# EAGLE board Chronos (EAGLE 9.7.0)
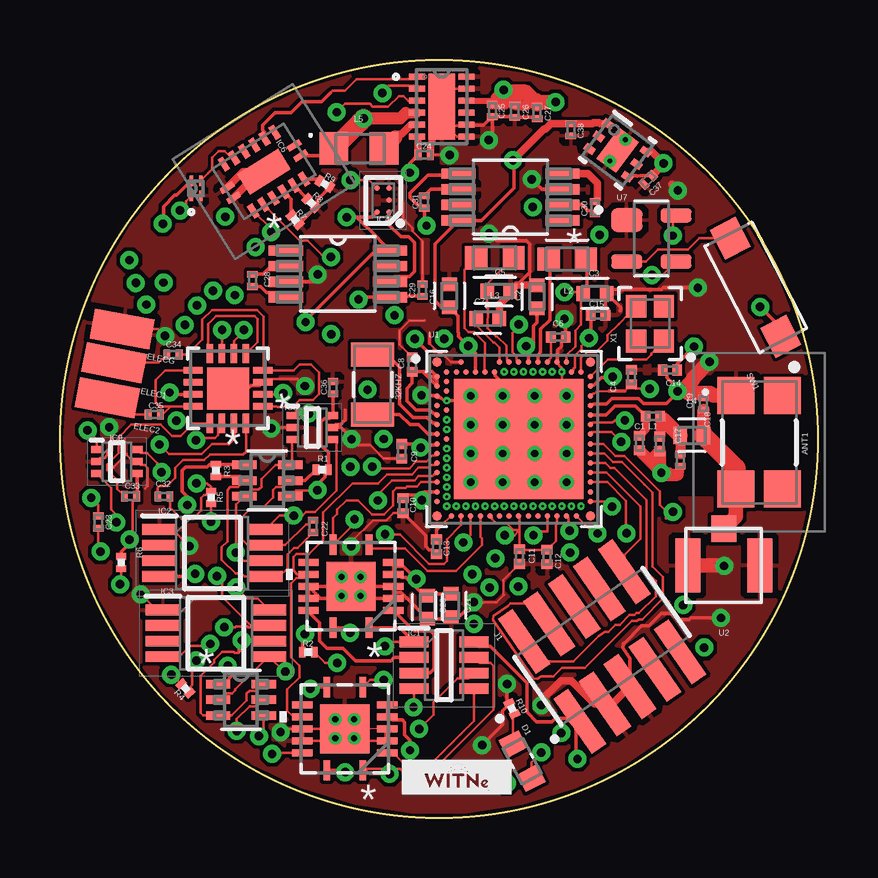
[diagram p3: board, top side]
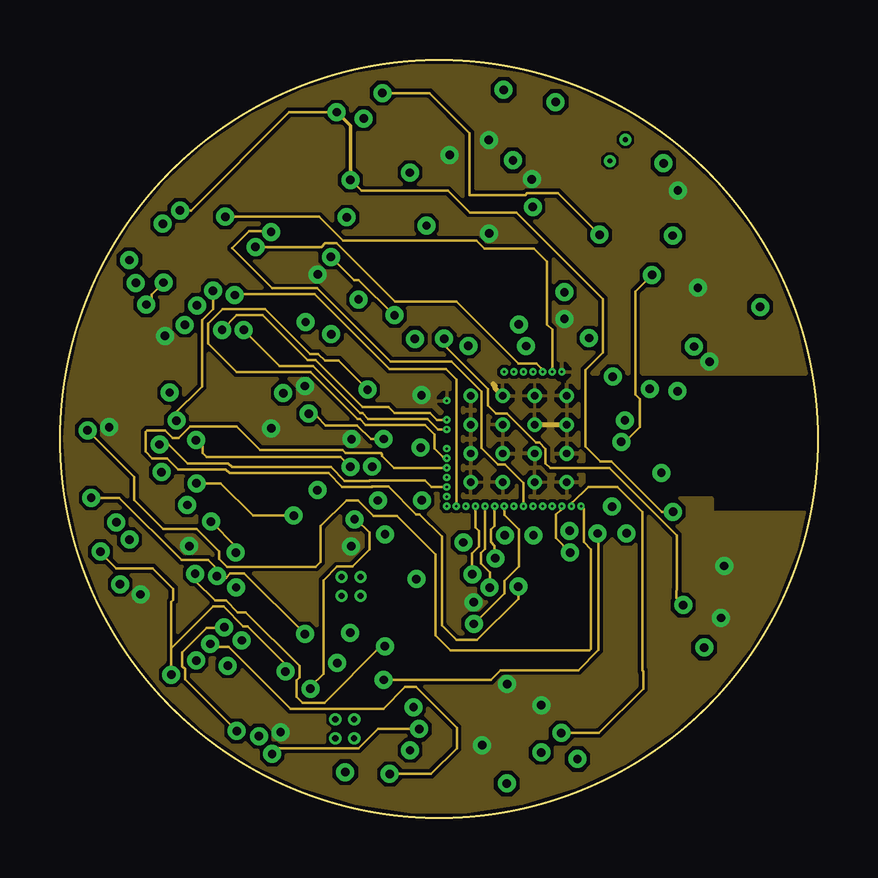
[diagram p4: board, inner layer Route2]
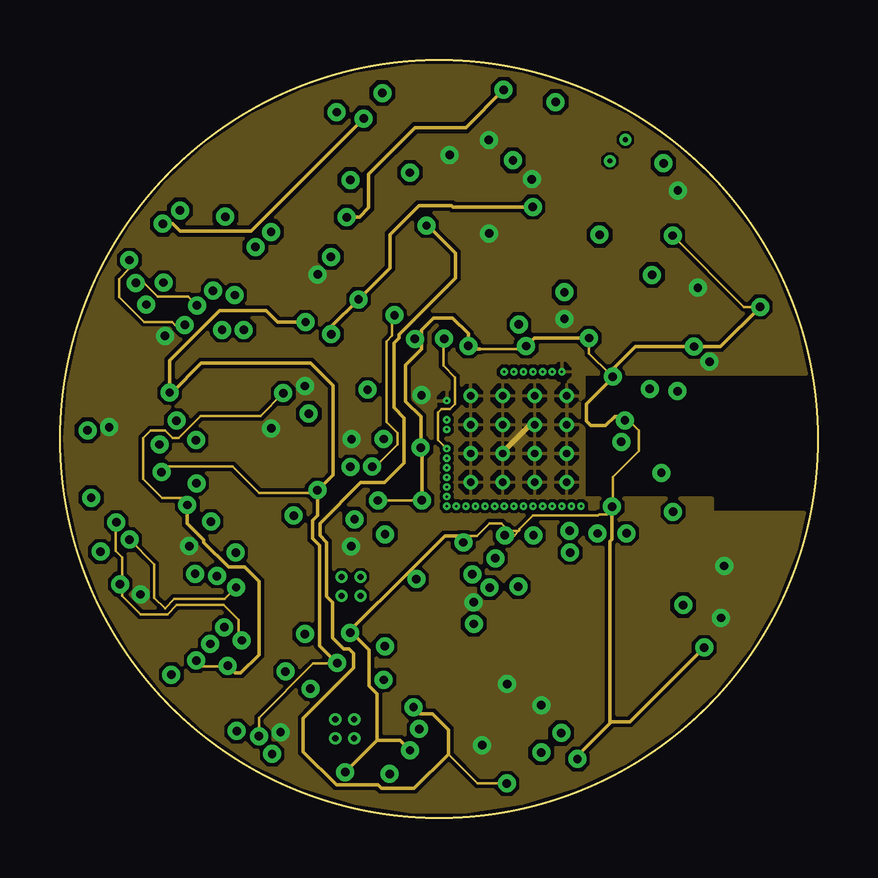
[diagram p5: board, inner layer Route15]
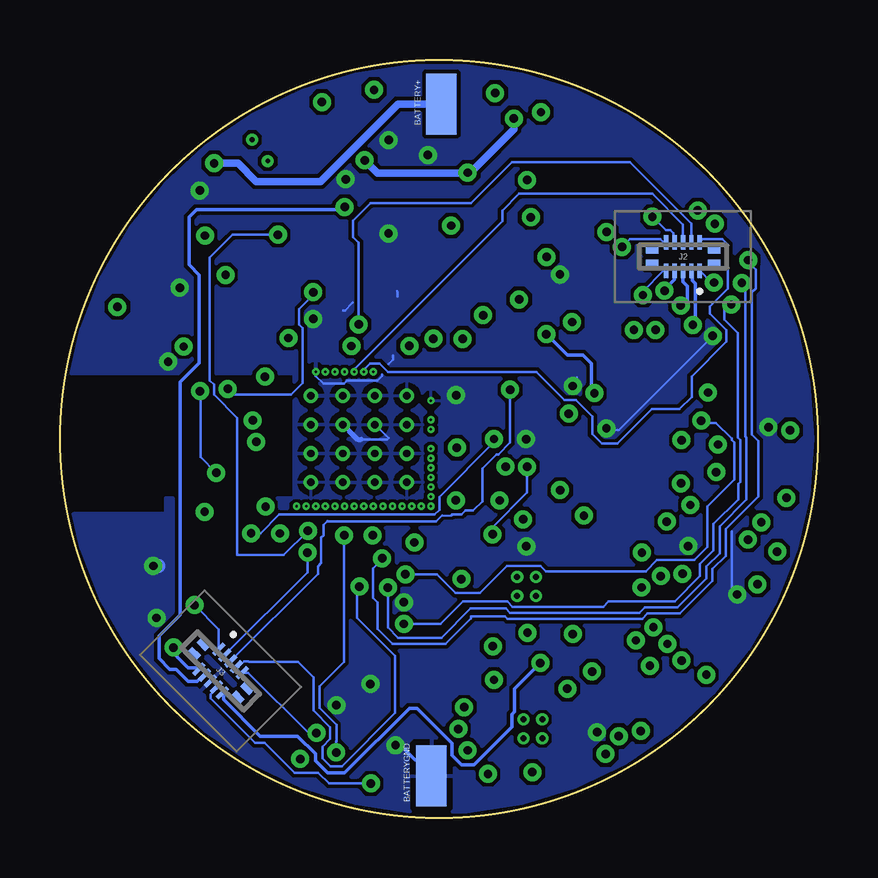
[diagram p6: board, bottom side, seen from below]

Size 31.59 x 31.59 mm. Coordinates in mm from the lower left corner, seen from the top.
Outline: circle at 15.79,15.79 radius 15.79
Copper layers (1+2*15+16): Top / Route2 / Route15 / Bottom
Stack-up 4 Layer Stack: Top SilkScreen Epoxy Ink / Top SolderMask SR:Green 0.0254mm Dk 4.3 / Top Surface Finish Lead-Free 0.02mm / Top CuFoil:007 0.035mm / Dielectric-1 Prepreg:001 0.064mm / Dielectric-2 Prepreg:001 0.064mm / Route2 CuFoil:007 0.035mm / Dielectric-3 Core:066 0.711mm / Route15 CuFoil:007 0.035mm / Dielectric-4 Prepreg:001 0.064mm / Dielectric-5 Prepreg:001 0.064mm / Bottom CuFoil:007 0.035mm / Bottom Surface Finish Lead-Free 0.02mm / Bottom SolderMask SR:Green 0.0254mm Dk 4.3 / Bottom SilkScreen Epoxy Ink
Design rules: minimum copper width 0.05mm, minimum drill size 0.35mm, copper clearance wire_polygon to wire_polygon 6mil, copper clearance wire_polygon to pad_smd 6mil, copper clearance wire_polygon to via 6mil, copper clearance pad_smd to pad_smd 6mil, copper clearance pad_smd to via 6mil, copper clearance via to via 6mil, copper clearance smd to pad (same net) 6mil, copper clearance smd to via (same net) 6mil, copper clearance smd to smd (same net) 6mil, dimension clearance 0.1mm, via restrict clearance 0mil, restrict clearance 0mil, drill distance 6mil, keepout clearance 0mil

## Footprints (pad centres in the part's own frame; a part is rotated, then mirrored left to right if it is on the bottom)
XTAL_3215_N = smd 1 x 1.8: 1 -1.25,0; 2 1.25,0
1461750001 = smd 1.54 x 1.54: 1 -1.95,-0.97; 2 1.95,-0.97; 3 1.95,0.97; 4 -1.95,0.97
SMD1,27-2,54 = smd 1.27 x 2.54: 1 0,0
RESC0201_N = smd 0.4 x 0.45: 1 -0.305,0; 2 0.305,0
CAPC1005X60 = smd 0.56 x 0.629: 1 -0.485,0; 2 0.485,0
RESC0201_L = smd 0.28 x 0.43: 1 -0.255,0; 2 0.255,0
LEDC1608X35N = smd 0.81 x 0.93: A 0.81,0; C -0.81,0
SOT65P280X145-8N = smd 1.2 x 0.45: 1 -1.25,0.975; 2 -1.25,0.325; 3 -1.25,-0.325; 4 -1.25,-0.975; 5 1.25,-0.975; 6 1.25,-0.325; 7 1.25,0.325; 8 1.25,0.975
SOP65P490X110-8N = smd 1.425 x 0.45: 1 -2.212,0.975; 2 -2.212,0.325; 3 -2.212,-0.325; 4 -2.212,-0.975; 5 2.212,-0.975; 6 2.212,-0.325; 7 2.212,0.325; 8 2.212,0.975
BGA5C50P2X3_89X139X50 = smd 0.226 x 0.226: A1 -0.25,0.5; A2 0.25,0.5; B1 -0.25,0; C1 -0.25,-0.5; C2 0.25,-0.5
TMUX1308QBQBRQ1 = smd 0.25 x 0.6: 1 -0.25,1.65; 8 -0.25,-1.65; 9 0.25,-1.65; 16 0.25,1.65 | smd 0.6 x 0.25: 2 -1.15,1.25; 3 -1.15,0.75; 4 -1.15,0.25; 5 -1.15,-0.25; 6 -1.15,-0.75; 7 -1.15,-1.25; 10 1.15,-1.25; 11 1.15,-0.75; 12 1.15,-0.25; 13 1.15,0.25; 14 1.15,0.75; 15 1.15,1.25 | smd 1 x 2: 17 0,0
WSON_94DSSR_TEX = smd 0.66 x 0.254: 1 -1.029,1.25; 2 -1.029,0.75; 3 -1.029,0.25; 4 -1.029,-0.25; 5 -1.029,-0.75; 6 -1.029,-1.25; 7 1.029,-1.25; 8 1.029,-0.75; 9 1.029,-0.25; 10 1.029,0.25; 11 1.029,0.75; 12 1.029,1.25 | smd 1.092 x 2.743: 13 0,0
SOTFL50P160X60-6N = smd 0.475 x 0.3: 1 -0.838,0.5; 2 -0.838,0; 3 -0.838,-0.5; 4 0.838,-0.5; 5 0.838,0; 6 0.838,0.5
SAMTEC_FTSH-105-01-F-DV-P-TR = smd 0.74 x 2.79: 01 -2.54,-2.035; 02 -2.54,2.035; 03 -1.27,-2.035; 04 -1.27,2.035; 05 0,-2.035; 06 0,2.035; 07 1.27,-2.035; 08 1.27,2.035; 09 2.54,-2.035; 10 2.54,2.035
BM28B0610DP2035V53 = smd 0.18 x 0.615: 1 -0.7,0.593; 2 -0.7,-0.592; 3 -0.35,0.593; 4 -0.35,-0.592; 5 0,0.593; 6 0,-0.592; 7 0.35,0.593; 8 0.35,-0.592; 9 0.7,0.593; 10 0.7,-0.592 | smd 0.52 x 0.4: MP1 -1.29,0.325; MP2 -1.29,-0.325; MP3 1.29,0.325; MP4 1.29,-0.325
INDC1608X95N = smd 0.9 x 0.97: 1 -0.785,0 | smd 0.933 x 0.97: 2 0.769,0
INDC1006X60N = smd 0.56 x 0.729: 1 -0.485,0; 2 0.485,0
RESC0805_N = smd 1.2 x 1.35: 1 -1.1,0; 2 1,0
R0201 = smd 0.28 x 0.43: 1 -0.255,0; 2 0.255,0
SENSOR_MK24-A-3 = smd 1.4 x 1.2: 1 -2.3,0; 2 2.3,0
XCVR_NRF5340-QKAA-R7 = drill 0.305 pad 0.61: 35 -1.8,-1.8; 36 -0.467,-1.8; 37 0.867,-1.8; 38 2.2,-1.8; 39 -1.8,-0.6; 40 -0.467,-0.6; 41 0.867,-0.6; 43 2.2,-0.6; 44 -1.8,0.6; 45 -0.467,0.6; 46 0.867,0.6; 47 2.2,0.6; 48 -1.8,1.8; 49 -0.467,1.8; 50 0.867,1.8; 51 2.2,1.8 | smd 5.4 x 5: 104 0.2,0 | smd 0.4 x 0.4: A1 -3.2,3.2; A31 3.2,3.2; AL1 -3.2,-3.2; AL31 3.2,-3.2 | smd 0.225 x 0.225: A5 -2.2,3.2; A13 -0.6,3.2; A15 -0.2,3.2; A17 0.2,3.2; A19 0.6,3.2; A21 1,3.2; A23 1.4,3.2; A25 1.8,3.2; A27 2.2,3.2; AA1 -3.2,-1; AA31 3.2,-1; AB2 -2.8,-1.2; AC1 -3.2,-1.4; AC31 3.2,-1.4; AD2 -2.8,-1.6; AE1 -3.2,-1.8; AE31 3.2,-1.8; AF2 -2.8,-2; AG1 -3.2,-2.2; AG31 3.2,-2.2; AH2 -2.8,-2.4; AJ1 -3.2,-2.6; AJ31 3.2,-2.6; AK2 -2.8,-2.8; AK4 -2.4,-2.8; AK6 -2,-2.8; AK8 -1.6,-2.8; AK10 -1.2,-2.8; AK12 -0.8,-2.8; AK14 -0.4,-2.8; AK16 0,-2.8; AK18 0.4,-2.8; AK20 0.8,-2.8; AK22 1.2,-2.8; AK24 1.6,-2.8; AK26 2,-2.8; AK28 2.4,-2.8; AK30 2.8,-2.8; AL3 -2.6,-3.2; AL5 -2.2,-3.2; AL7 -1.8,-3.2; AL9 -1.4,-3.2; AL11 -1,-3.2; AL13 -0.6,-3.2; AL15 -0.2,-3.2; AL17 0.2,-3.2; AL19 0.6,-3.2; AL21 1,-3.2; AL23 1.4,-3.2; AL25 1.8,-3.2; AL27 2.2,-3.2; AL29 2.6,-3.2; B2 -2.8,2.8; B4 -2.4,2.8; B6 -2,2.8; B8 -1.6,2.8; B10 -1.2,2.8; B12 -0.8,2.8; B14 -0.4,2.8; B16 0,2.8; B18 0.4,2.8; B20 0.8,2.8; B22 1.2,2.8; B24 1.6,2.8; B26 2,2.8; B28 2.4,2.8; B30 2.8,2.8; C1 -3.2,2.6; C31 3.2,2.6; D2 -2.8,2.4; E1 -3.2,2.2; E31 3.2,2.2; F2 -2.8,2; G1 -3.2,1.8; G31 3.2,1.8; H2 -2.8,1.6; J1 -3.2,1.4; J31 3.2,1.4; K2 -2.8,1.2; L1 -3.2,1; L31 3.2,1; M2 -2.8,0.8; N1 -3.2,0.6; N31 3.2,0.6; P2 -2.8,0.4; R1 -3.2,0.2; R31 3.2,0.2; T2 -2.8,0; U1 -3.2,-0.2; U31 3.2,-0.2; V2 -2.8,-0.4; W1 -3.2,-0.6; W31 3.2,-0.6; Y2 -2.8,-0.8 | drill 0.1 pad 0.23: P$3 -2.8,1.6; P$5 -2.8,0.8; P$6 -2.8,0.4; P$8 -2.8,-0.4; P$9 -2.8,-0.8; P$10 -2.8,-1.2; P$11 -2.8,-1.6; P$12 -2.8,-2; P$13 -2.8,-2.4; P$14 -2.8,-2.8; P$15 -2.4,-2.8; P$16 -2,-2.8; P$17 -1.6,-2.8; P$18 -1.2,-2.8; P$19 -0.8,-2.8; P$20 -0.4,-2.8; P$21 0,-2.8; P$22 0.4,-2.8; P$23 0.8,-2.8; P$24 1.2,-2.8; P$25 1.6,-2.8; P$26 2,-2.8; P$27 2.4,-2.8; P$28 2.8,-2.8; P$29 -0.4,2.8; P$30 0,2.8; P$31 0.4,2.8; P$32 0.8,2.8; P$33 1.2,2.8; P$34 1.6,2.8; P$35 2,2.8
U.FL-R-SMT-1(XX) = smd 1.05 x 1.1: 1 0,1.525 | smd 1.05 x 2.25: 2 -1.5,0; 3 1.5,0
RGY14_2P05X2P05 = smd 0.28 x 0.85: 1 -0.75,1.731; 7 -0.75,-1.731; 8 0.75,-1.731; 14 0.75,1.731 | smd 0.85 x 0.28: 2 -1.769,1; 3 -1.769,0.5; 4 -1.769,0; 5 -1.769,-0.5; 6 -1.769,-1; 9 1.769,-1; 10 1.769,-0.5; 11 1.769,0; 12 1.769,0.5; 13 1.769,1 | smd 2.05 x 2.05: 15 0,0 | drill 0.254 pad 0.508: V -0.394,-0.394; V_1 -0.394,0.394; V_2 0.394,-0.394; V_3 0.394,0.394
SOT-363-6_2P2X1P35_ONS = smd 1.016 x 0.356: 1 -0.953,0.65; 2 -0.953,0; 3 -0.953,-0.65; 4 0.953,-0.65; 5 0.953,0; 6 0.953,0.65
SOT192P237X122-4N = smd 1.3 x 0.99: 1 -1.025,0.765 | smd 1.3 x 0.6: 2 -1.025,-0.96; 3 1.025,-0.96; 4 1.025,0.96
DRV0006A = smd 0.45 x 0.3: 1 -0.975,0.65; 2 -0.975,0; 3 -0.975,-0.65; 4 0.975,-0.65; 5 0.975,0; 6 0.975,0.65 | smd 1 x 1.6: 7 0,0 | drill 0.203 pad 0.5: V 0,-0.55; V_1 0,0.55
CP_16_22_ADI = smd 0.275 x 0.805: 1 0.75,1.452; 2 0.25,1.452; 3 -0.25,1.452; 4 -0.75,1.452; 9 -0.75,-1.452; 10 -0.25,-1.452; 11 0.25,-1.452; 12 0.75,-1.452 | smd 0.805 x 0.275: 5 -1.452,0.75; 6 -1.452,0.25; 7 -1.452,-0.25; 8 -1.452,-0.75; 13 1.452,-0.75; 14 1.452,-0.25; 15 1.452,0.25; 16 1.452,0.75 | smd 1.75 x 1.75: HTAB 0,0
DGK8 = smd 1.422 x 0.432: 1 -2.172,0.975; 2 -2.172,0.325; 3 -2.172,-0.325; 4 -2.172,-0.975; 5 2.172,-0.975; 6 2.172,-0.325; 7 2.172,0.325; 8 2.172,0.975
X2SON4XP6XP6_NEX-L = smd 0.432 x 0.152: 1 -0.318,0.2; 2 -0.318,-0.2; 3 0.318,-0.2; 4 0.318,0.2
BT-XTAL_2016_N = smd 0.95 x 0.85: 1 -0.725,-0.575; 2 0.725,-0.575; 3 0.725,0.575; 4 -0.725,0.575

## Placement (x,y rotation side)
32KHZ  32kHZ  [XTAL_3215_N]  13.03,18.06 270 top
ANT1  146175-0001  [1461750001]  29.15,15.64 270 top
BATTERY+  [SMD1,27-2,54]  15.69,29.75 0 bottom
BATTERYGND  [SMD1,27-2,54]  16.1,1.74 0 bottom
C1  0.7p  [RESC0201_N]  24.15,15.61 270 top
C2  1u  [CAPC1005X60]  19.88,21.71 90 top
C3  1u  [CAPC1005X60]  22.3,21.85 0 top
C4  2.2n  [RESC0201_N]  23.83,18.37 90 top
C5  1u  [CAPC1005X60]  18.29,21.95 0 top
C6  100n  [RESC0201_N]  20.77,20.04 0 top
C7  1u  [CAPC1005X60]  17.83,20.8 359.7 top
C8  100n  [RESC0201_N]  14.68,18.89 90 top
C9  100n  [RESC0201_N]  14.25,15.27 270 top
C10  100n  [RESC0201_N]  14.3,13 270 top
C11  100n  [RESC0201_N]  19.15,10.88 270 top
C12  100n  [RESC0201_N]  20.3,10.86 270 top
C13  100n  [RESC0201_N]  15.7,11.29 270 top
C14  100n  [RESC0201_N]  25.42,18.66 180 top
C15  100n  [RESC0201_N]  22.44,20.95 0 top
C16  1u  [CAPC1005X60]  16.23,21.75 90 top
C17  N.C.  [RESC0201_N]  25,15.58 270 top
C18  [RESC0201_L]  25.86,14.9 270 top
C19  [RESC0201_L]  26.82,17.25 90 top
C20  1u  [CAPC1005X60]  15.32,8.78 270 top
C21  0.1u  [CAPC1005X60]  16.31,8.85 270 top
C22  10u  [RESC0201_L]  10.55,12.14 270 top
C23  10u  [RESC0201_L]  1.6,12.32 270 top
C24  2.2u  [RESC0201_L]  15.19,27.63 0 top
C25  10u  [RESC0201_L]  18.03,29.48 270 top
C26  10u  [RESC0201_L]  18.96,29.45 270 top
C27  10u  [RESC0201_L]  19.89,29.4 270 top
C28  10u  [RESC0201_L]  8.03,22.4 270 top
C29  10u  [RESC0201_L]  15.11,21.99 90 top
C30  10u  [RESC0201_L]  22.3,25.43 90 top
C31  10u  [RESC0201_L]  15.19,25.67 90 top
C32  10u  [RESC0201_L]  4.33,13.39 0 top
C33  10u  [RESC0201_L]  2.94,13.4 0 top
C34  10u  [RESC0201_L]  4.71,19.3 0 top
C35  10u  [RESC0201_L]  3.93,16.8 0 top
C36  0.1u  [RESC0201_L]  11.38,17.92 90 top
C37  1u  [RESC0201_L]  24.52,26.59 224.6 top
C38  1u  [RESC0201_L]  21.3,28.67 270 top
D1  LTST-C190KRKT  [LEDC1608X35N]  19.27,2.36 297.9 top
ELEC1  [SMD1,27-2,54]  2.26,18.96 78.6 top
ELEC2  [SMD1,27-2,54]  1.97,17.5 78.8 top
ELECG  [SMD1,27-2,54]  2.59,20.37 79.6 top
IC1  OPA2369AIDCNR  [SOT65P280X145-8N]  16.01,6.35 0 top
IC2  LT1990IMS8-10#PBF  [SOP65P490X110-8N]  6.35,11.03 0 top
IC3  LT1990IMS8-10#PBF  [SOP65P490X110-8N]  6.5,7.68 0 top
IC4  TS5A3166YZPR  [BGA5C50P2X3_89X139X50]  13.48,25.73 180 top
IC6  TMUX1308QBQBRQ1  [TMUX1308QBQBRQ1]  8.5,26.93 302.1 top
IC7  TPS61094DSSRWSON_94DSSR_TEX  [WSON_94DSSR_TEX]  15.91,29.64 0 top
IC8  INA185A1IDRLT  [SOTFL50P160X60-6N]  10.52,16.26 0 top
IC9  INA185A1IDRLT  [SOTFL50P160X60-6N]  2.37,14.84 0 top
J1  FTSH-105-01-F-DV-P-TR  [SAMTEC_FTSH-105-01-F-DV-P-TR]  22.6,7.13 34.8 top
J2  BM28B0.6-10DP_2-0.35V_53_  [BM28B0610DP2035V53]  5.61,23.39 180 bottom
J3  BM28B0.6-10DP_2-0.35V_53_  [BM28B0610DP2035V53]  24.89,6.12 315 bottom
L1  2.2n  [RESC0201_N]  24.72,16.73 180 top
L2  10u  [INDC1608X95N]  21.14,23.28 180 top
L3  10u  [INDC1608X95N]  18.12,23.33 180 top
L4  [INDC1006X60N]  26.34,15.93 0 top
L5  2.2uH  [RESC0805_N]  12.51,27.89 0 top
R1  1k  [R0201]  10.93,14.5 0 top
R2  1k  [R0201]  10.35,6.9 0 top
R3  1k  [R0201]  6.5,14.47 270 top
R4  1k  [R0201]  5.23,5.38 133.8 top
R5  100  [R0201]  6.3,13.35 270 top
R6  100  [R0201]  2.55,10.63 270 top
R7  12k  [R0201]  9.81,24.92 310.5 top
R8  50k  [R0201]  10.48,25.62 315.4 top
R9  110k  [R0201]  11.04,26.42 328.7 top
R10  1k  [R0201]  18.84,4.54 296.5 top
SW1  MK24-A-3  [SENSOR_MK24-A-3]  29.01,22.11 117.3 top
U1  NRF5340-QKAA-R7  [XCVR_NRF5340-QKAA-R7]  18.92,15.78 0 top
U2  U.FL-R-SMT-101  [U.FL-R-SMT-1(XX)]  27.67,10.51 0 top
U3  DAC8832ICRGYTRGY14_2P05X2P05  [RGY14_2P05X2P05]  12.13,9.64 180 top
U4  DAC8832ICRGYTRGY14_2P05X2P05  [RGY14_2P05X2P05]  11.87,3.7 180 top
U5  MBT3946DW1T1GSOT-363-6_2P2X1P35_ONS  [SOT-363-6_2P2X1P35_ONS]  8.64,14.05 0 top
U6  MBT3946DW1T1GSOT-363-6_2P2X1P35_ONS  [SOT-363-6_2P2X1P35_ONS]  7.54,4.91 0 top
U7  MAX6816EUS+T  [SOT192P237X122-4N]  24.66,24.14 0 top
U9  TLV75730PDRVRDRV0006A  [DRV0006A]  23.25,27.82 323.6 top
U10  ADG4612BCPZ-REEL7CP_16_22_ADI  [CP_16_22_ADI]  7,17.89 270 top
U11  TL7660CDGKRDGK8  [DGK8]  11.59,22.67 0 top
U12  74LVC1G14GX4ZX2SON4XP6XP6_NEX-L  [X2SON4XP6XP6_NEX-L]  5.67,26.23 90 top
U13  TL7660CDGKRDGK8  [DGK8]  18.78,25.87 180 top
X1  32MHz  [BT-XTAL_2016_N]  24.6,20.59 90 top

## Tracks (layer width: path | path; a pad name or v marks a point on that pad's centre or on a via)
CURSENSE1  (via drill 0.35)
  Top 0.102: U1.AE31 22.81,13.98 23.59,13.2 23.59,11.89 | IC8.1 9.87,16.94 10.27,16.94 v10.37,16.84 | 23.59,11.88 v23.62,11.85
  Top 0.152: 23.59,11.89 23.59,11.88
  Route2 0.102: v10.37,16.84 10.49,16.73 10.71,16.73 11.08,16.36 12.4,16.36 12.96,15.79 v13.49,15.79
  Bottom 0.102: v23.62,11.85 23.23,11.85 22.45,12.63 15.98,12.63 15.77,12.84 15.77,13.37 13.47,15.67 13.47,15.76 v13.49,15.79
CURSENSE2  (via drill 0.35)
  Top 0.102: v1.15,16.14 1.54,15.76 IC9.1
  Route2 0.102: U1.P$28 21.83,12.87 21.83,11.49 22.14,11.18 22.14,7.04 22.08,6.98 16.43,6.98 16.28,6.98 15.66,7.6 15.66,10.97 14.05,12.59 13.07,12.59 12.42,13.23 11.94,13.23 10.86,12.15 10.86,10.66 10.66,10.46 6.97,10.46 6.64,10.79 6.64,11.09 5.69,12.04 4.29,12.04 3.09,13.24 3.09,14.2 v1.15,16.14
GND  (via drill 0.35)
  Top 0.05: U4.4 12.52,3.7 | U4.12 10.98,3.2 11.3,2.88 12.48,2.88 12.6,2.99 | U4.15 10.45,3.7 | U1.104 17.81,17.1 17.81,17.59 17.96,17.59 U1.49 | 12.82,9.64 12.82,9.57 12.96,9.43 12.96,9.07 12.82,8.94 12.82,8.86 12.75,8.86 12.71,8.82 12.35,8.82 12.21,8.96 12.13,8.96 | 11.45,9.65 11.26,9.65 11.26,9.64
  Top 0.102: ANT1.1 26.91,17.59 C19.2 | U1.A25 20.81,18.9 20.81,18.85 20.92,18.74 U1.P$35 20.92,17.78 U1.51 | C2.2 19.59,22.49 19.59,23.09 | 22.24,17.24 22.19,17.19 U1.J31 | U4.3 13.59,3.2 12.81,3.2 12.6,2.99 | 11.21,3.68 11.18,3.7 10.45,3.7 U4.11 9.34,3.7 v9.2,3.56 | U4.12 10.94,3.2 11.17,2.97 | U3.11 10.39,9.61 10.39,9.14 | U3.4 13.9,9.39 U3.3 | IC2.1 4.72,12.01 5.06,11.67 5.06,11.66 v5.39,11.32 | 2.77,15.17 2.77,15.11 3.04,14.84 IC9.5 3.36,14.7 3.53,14.7 3.65,14.58 3.65,13.83 3.55,13.73 | 2.77,15.17 2.69,15.24 2.69,15.75 2.71,15.76 | U10.3 8.61,18.29 9.91,18.29 v10.21,18 | IC7.12 IC7.11 16.04,30.39 | 16.04,30.39 15.83,30.39 15.82,30.38 | 16.08,28.86 16.91,28.86 IC7.8 16.94,28.86 IC7.7 16.55,28.39 16.2,28.74 | 16.08,28.86 15.94,28.86 15.94,30.29 16.04,30.39 | 16.2,28.74 16.08,28.86 | IC7.13 16.2,29.35 16.2,28.74 | C24.2 v16.24,27.63 v16.25,27.63 | IC8.2 8.69,16.26 8.59,16.17 | 18.46,17.95 18.46,18.15 18.39,18.22 | U1.A5 16.29,18.98 15.89,19.39 15.78,19.39 15.4,19.76 15.4,20.18 | C9.2 13.49,14.97 12.92,15.54 12.44,15.54 | C10.2 13.92,12.7 13.61,12.39 13.05,12.39 12.14,11.49 v12.14,11.32 | IC9.2 1.68,14.99 1.86,14.99 1.98,15.11 1.98,15.28 2.16,15.47 2.16,16.17 v2.05,16.28 | IC3.1 4.04,8.66 3.39,9.31 v3.36,9.31 | ELECG.1 4.09,20.37 v4.38,20.08 | C11.2 18.49,9.92 18.49,9.31 18.51,9.29 18.51,9.28 18.21,8.98 v17.25,8.98 | C8.2 14.16,19.72 14.16,20.3 14.57,20.72 15.2,20.72 | 2.77,15.17 2.23,14.63 2.23,14.59 2.24,14.59 | 13.19,9.64 12.82,9.64 | 14.3,25.65 14.3,24.98 14.7,24.58 14.7,24.44 15.11,24.03 C29.2 | 18.46,17.91 U1.49 | 18.39,18.22 18.35,18.19 17.96,17.8 17.96,17.59 | 18.39,18.22 18.12,18.48 U1.B12
  Top 0.152: J1.05 23.76,6.64 23.47,7.07 23.5,7.26 23.52,7.27 24.25,7.99 24.56,7.99 25.08,8.51 25.46,8.51 25.71,8.26 26.23,8.26 26.3,8.33 v27.56,8.33 | 22.24,17.24 22.79,17.24 23.02,17.47 24.12,17.47 24.32,17.27 25.29,17.27 25.75,17.73 | 25.8,17.78 | U1.48 16.92,17.38 U1.P$3 16.01,17.38 15.86,17.52 15.78,17.52 U1.G1 15.09,17.59 v15.07,17.62 | C15.2 22.74,21.81 C3.2 | C3.2 23.37,21.27 23.37,21.14 23.34,21.14 | v26.59,22.09 25.15,22.09 25.08,22.02 22.96,22.02 C3.2 | C13.2 15.52,11.17 15.38,11.17 15.25,11.3 15.25,11.75 C10.2 | 13.19,9.64 U3.4 U3.3 13.1,9.14 12.82,8.86 | 12.13,8.96 11.94,8.77 11.54,8.77 11.16,9.14 10.86,9.14 | 10.86,9.14 10.39,9.14 U3.12 | 13.9,9.39 14.22,9.39 C20.2 16.24,8.29 C21.2 16.63,8.36 v17.25,8.98 | U4.4 13.59,3.65 13.59,3.2 | U4.11 U4.12 | 12.22,15.76 11.72,16.26 IC8.5 11.48,16.38 11.69,16.38 11.89,16.58 11.89,16.99 | U10.3 8.32,18.01 7.96,18.01 7.84,17.89 U10.HTAB | C25.2 18.93,29.22 C26.2 19.83,29.2 C27.2 | C25.2 17.66,28.86 16.94,28.86 | v17.88,28.25 18.02,28.39 C25.2 | C31.2 15.46,26.2 U13.6 | R9.2 10.78,25.8 10.78,25.76 10.66,25.64 R8.2 9.97,24.75 R7.2 | 25.8,17.78 25.75,17.73 | C14.2 25.3,18.48 25.3,18.34 25.75,17.9 25.75,17.73 | U11.3 10.73,22.34 10.75,22.36 v10.75,22.65 | C7.2 18.32,21.48 19.59,22.75 19.59,23.91 19.45,24.05 18.2,24.05 v17.89,24.36 | v18.64,5.57 18.64,4.86 18.72,4.78 | R10.1 18.72,4.78 | U13.3 20.09,26.2 v19.67,26.61 | 12.22,15.76 12.44,15.54 | 12.22,15.76 12.17,15.76 v12.16,15.78 | v17.6,3.02 18.46,3.87 18.46,4.45 18.72,4.71 18.72,4.78 | v21.03,20.79 21.08,20.75 C6.2 20.9,19.86 20.9,19.63 20.75,19.48 20.75,19.06 20.72,19.03 U1.A25 | 10.86,9.14 U3.11 11.26,9.64
  Top 0.152: 18.46,17.91 18.46,17.95 18.46,18.12 | 18.35,18.22 18.14,18.43 18.14,18.56 U1.B12 | 18.35,18.22 18.35,18.19 | v25.75,17.78 25.8,17.78 | 18.35,18.22 18.37,18.2 19.17,18.2 U1.50
  Top 0.203: C17.2 25.07,15.21 v25.07,14.37 | 25.07,14.39 24.98,14.48 24.71,14.76 24.61,14.86 24.51,14.96 | 24.28,15.18 C1.2
  Top 0.254: 25.39,14.39 25.44,14.39 25.62,14.22 | 25.62,14.22 25.64,14.19 | C18.2 25.86,14.46 25.62,14.22
  Top 0.305: C18.2 25.86,14.41 25.74,14.29 25.64,14.19 | 25.86,14.46 25.79,14.39 25.39,14.39 | J1.05 23.04,4.74 J1.03 22.27,4.74 21.32,5.69 20.88,5.69 20.72,5.54 20.71,5.54 20.16,4.99 20.16,4.79 v20.06,4.69 | C7.2 18.32,21.39 18.78,21.85 C5.2 19.02,22.2 C2.2 | C24.2 15.44,28.06 15.52,28.13 15.52,28.44 15.94,28.86 | v25.76,26.15 25.5,26.41 | IC6.8 7.64,26.93 IC6.17 8.33,26.93 IC6.9
  Top 0.406: 25.39,14.39 25.37,14.37 v25.07,14.37
  Top 0.508: 24.51,14.96 24.28,15.18 | 24.61,14.86 24.61,14.88 C17.2 25,14.5 24.98,14.48 | 25.09,14.37 v25.07,14.37 | 24.71,14.76 25.07,14.39 25.09,14.37 | 25.09,14.37 25.17,14.29 25.74,14.29
  Top 0.61: ANT1.1 27.23,17.59 27.12,17.71 26.18,17.71 26.18,17.78 | 26.18,17.78 25.8,17.78 | U2.2 27.67,10.51 v27.69,10.49 | 26.18,17.78 26.18,18.04 26.39,18.25 26.39,18.32 v27.08,19.01
  Route2 0.203: U1.46 U1.47 | U1.49 18.14,17.9 18.14,18 18.06,18.08
  Route15 0.203: U1.46 19.61,16.38 18.46,15.23 U1.40 | 18.44,17.57 U1.49
  Bottom 0.102: 17.51,21.72 17.51,21.91 17.54,21.94 | 17.69,19.26 17.69,19.09 17.88,18.91 | v25.07,14.37 25.73,15.03 25.73,17.76 v25.75,17.78 | 19.79,21.14 19.71,21.14 19.39,21.46 | v10.21,18 10.21,18.18 10.04,18.34 | v5.39,11.32 5.37,11.29 5.14,11.29 | 3.58,11.92 3.58,9.56 3.36,9.34 v3.36,9.31 | v2.05,16.28 v2.06,16.27 2.23,16.27 | U1.46 19.55,16.14 | 19.03,15.77 17.94,15.77 17.89,15.82 U1.45 | U1.P$35 20.92,18.42 20.6,18.09 19.75,18.09 19.62,18.23 18.36,18.23 18.17,18.42 18.17,18.48 | v4.38,20.08 8.29,16.17 8.59,16.17
  Bottom 0.152: 10.77,22.31 10.77,22.32 10.75,22.34 v10.75,22.65 | 18.44,5.54 18.58,5.54 18.6,5.57 v18.64,5.57 | v17.89,24.36 17.94,24.3 18.03,24.3 18.14,24.19 | BATTERYGND.1 17.38,3.02 v17.6,3.02 | 21.19,20.84 21.14,20.79 v21.03,20.79
  Bottom 0.203: 19.55,16.14 19.17,15.77 19.03,15.77
  Bottom 0.61: v27.69,10.49 27.49,10.49
  other vias: 8.81,16.23
  pour Top: -10.66,35.79 31.39,35.79 31.39,18.44 21.89,18.44 21.89,13.39 27.24,13.39 27.24,12.79 31.44,12.79 31.44,-2.21 -10.26,-2.21 -10.26,35.84 -10.66,35.84
  pour Bottom: -11.71,36.34 31.39,36.34 31.39,18.44 21.89,18.44 21.89,13.39 27.24,13.39 27.24,12.74 31.44,12.74 31.44,-2.11 -11.71,-2.11
  pour Route2: -12.76,36.78 31.41,36.78 31.41,18.44 21.91,18.44 21.91,13.39 27.25,13.39 27.25,12.79 32.18,12.79 32.18,-2.97 -12.61,-2.97 -12.61,36.79 -12.61,36.79
  pour Route15: -13.83,37.86 31.42,37.86 31.42,18.43 21.9,18.43 21.9,13.38 27.26,13.38 27.26,12.78 32.85,12.78 32.85,-3.82 -13.7,-3.82 -13.7,37.73 -13.78,37.73
HCSOUT1  (via drill 0.35)
  Top 0.102: IC2.6 7.68,10.71 7.39,10.99 | U5.6 8.99,14.7 8.4,14.11 8.4,13.79 8.28,13.67 7.96,13.67 U5.3 7.34,13.05 7.34,11.05 7.39,10.99 | U5.6 | R5.2 v6.3,12.35 v6.29,12.34 | 7.39,10.99 7.38,10.99 v7.33,11.05 | IC8.3 9.69,14.8 U5.6
  Route2 0.102: v6.29,12.34 7.33,11.31 v7.33,11.05
HCSOUT2  (via drill 0.35)
  Top 0.102: U6.6 8.23,5.29 7.9,5.29 7.78,5.18 7.78,4.88 7.16,4.26 U6.3 5.97,4.26 5.87,4.37 5.87,5.92 6.42,6.47 6.42,6.58 6.76,6.91 7.23,6.91 7.27,6.88 7.44,6.88 | 7.44,6.88 7.92,7.36 IC3.6 7.87,7.36 7.44,6.93 | 7.44,6.88 7.44,6.93 | IC9.3 2.14,13.74 2.14,12.85 2.35,12.64 v2.35,12.31 | 7.44,6.93 7.44,7.25 v7.58,7.39 | R6.2 2.55,9.78 v2.51,9.73
  Route15 0.102: 2.59,9.64 2.59,10.86 2.32,11.13 2.32,12.07 2.35,12.09 v2.35,12.31 | v7.58,7.39 7.44,7.52 7.44,8.24 6.82,8.86 4.87,8.86 4.48,8.47 3.37,8.47 2.59,9.25 2.59,9.64 | 2.59,9.64 v2.51,9.73
HCSS1  (via drill 0.35)
  Top 0.102: 7.03,15.59 7.04,15.59 7.03,15.58 6.34,15.58 5.91,15.16 4.55,15.16 v4.15,15.56
  Top 0.152: 7.03,15.59 7.25,15.81 U10.15
  Route2 0.102: U1.P$12 15.49,13.78 15.22,14.05 12.91,14.05 12.9,14.04 11.87,14.04 11.3,14.61 7.17,14.61 7.01,14.77 5.32,14.77 4.52,15.57 4.22,15.57 4.21,15.56 v4.15,15.56
HCSS2  (via drill 0.35)
  Top 0.102: U10.14 6.59,16.28 6.59,15.95 6.47,15.84 5.77,15.84 v5.67,15.74 | U1.AL5 16.72,12.2 16.13,11.61 16.13,10.7 16.01,10.59 15.39,10.59 14.17,11.81 v13.56,11.81 v13.55,11.81
  Route2 0.102: v5.67,15.74 5.94,15.47 5.94,15.19 6.11,15.03 11.71,15.03 v12.11,14.62
  Bottom 0.102: v12.11,14.62 12.11,13.55 13.55,12.11 v13.55,11.81
HCSS3  (via drill 0.35)
  Top 0.102: U10.7 6.75,20.32 v6.76,20.33
  Route2 0.102: v6.76,20.33 7.37,20.94 8.46,20.94 10.32,19.08 10.66,19.08 12.62,17.12 13.7,17.12 13.94,16.87 15.43,16.87 15.72,16.58 U1.P$5
HCSS4  (via drill 0.35)
  Top 0.102: U10.6 7.25,19.87 7.66,20.28 v7.66,20.33
  Route2 0.102: U1.P2 15.76,16.18 15.33,16.62 12.85,16.62 12.61,16.86 12.52,16.86 10.55,18.83 9.17,18.83 v7.66,20.33
INV1
  Top 0.152: IC1.2 13.93,6.68 13.79,6.54 12.32,6.54 11.81,7.05 11.13,7.05 10.81,7.37 10.81,8.12 10.36,8.57 U3.13
INV2  (via drill 0.35)
  Top 0.102: IC1.6 17.04,5.8 16.58,5.8 15.57,4.8 15.57,4.29 v14.98,3.7 | v8.84,2.66 8.89,2.7 U4.13
  Route2 0.102: v8.84,2.66 9.07,2.88 12.45,2.88 13.26,3.7 v14.98,3.7
IOUT1  (via drill 0.35)
  Top 0.102: IC2.8 9.15,12.59 v9.74,12.59 10.11,12.59 10.25,12.74 10.64,12.74 11.53,13.63 11.53,15.59 IC8.4 | C32.2 4.59,12.94 5.07,12.46 5.55,12.46 5.89,12.8 5.89,13.32 6,13.44 6.14,13.44 R5.1 6.3,13.78 6.14,13.94 v5.69,13.94
  Route2 0.102: v9.74,12.59 8.04,12.59 6.7,13.94 v5.69,13.94
IOUT2  (via drill 0.35)
  Top 0.102: C33.2 3.03,13.24 3.03,11.96 2.94,11.87 2.94,11.56 2.94,11.47 | v7.34,9.6 7.8,9.14 8.23,9.14 IC3.8
  Top 0.152: IC9.4 3.21,13.42 C33.2 | 2.94,11.47 2.55,11.08 R6.1 | 2.94,11.56 v2.91,11.59 v2.9,11.59 | v2.9,11.59
  Route15 0.102: v7.34,9.6 6.86,9.12 4.77,9.12 4.38,8.73 3.94,9.17 3.94,10.55 v2.9,11.59
LVSWITCH
  Top 0.152: U11.6 13.96,22.55 14.56,22.55 14.78,22.76 14.78,23.97 14.54,24.21 14.21,24.21 13.73,24.7 IC4.A1
MODESEL  (via drill 0.35)
  Top 0.102: U1.AL27 21.21,12.5 21.21,11.78 21.25,11.82 v21.25,11.95 | IC7.2 14.76,30.51 13.7,30.51 13.44,30.25 v13.44,30.21
  Route2 0.102: v13.44,30.21 15.4,30.21 17.08,28.53 17.08,25.96 19.4,25.96 19.47,26.04 20.76,26.04 v22.5,24.3
  Bottom 0.102: v22.5,24.3 24.39,24.3 25.34,23.35 25.34,18.22 25.17,18.05 25.17,17.63 24.2,16.66 24.2,10.95 22.25,10.95 v21.25,11.95
N$1
  Top 0.152: U1.L31 22.76,16.78 23.14,17.17 23.98,17.17 L1.2
  Top 0.305: L1.2 24.42,16.18 C1.1
N$2
  Top 0.102: X1.1 24.66,19.35 24.66,19.31 24.45,19.1 22.84,19.1 U1.C31
N$3
  Top 0.102: U1.B30 21.72,18.81 21.72,18.82 21.72,19.15 21.99,19.42 22.35,19.42 22.83,19.89 22.83,20.12 23.29,20.58 23.75,21.04 X1.3
N$4
  Top 0.102: U1.A23 20.41,19.08 20.41,19.11 20.47,19.17 C6.1
N$5
  Top 0.152: U1.A21 19.92,19.29 20.04,19.41 20.04,20.36 20.43,20.75 20.43,23.23 L2.2
N$6
  Top 0.102: L3.2 16.86,22.84 16.86,20.41 17.03,20.24 17.26,20.24 17.72,19.78 17.72,19.26 17.7,19.24 17.7,18.6 U1.B10
N$7
  Top 0.102: U1.A15 18.64,19.07 18.64,19.28 18.6,19.31 18.6,19.68 18.22,20.06 18.17,20.06 17.83,20.4 17.84,21.22 17.83,21.22 17.81,21.24 C5.1 17.81,22.23 L3.1
N$8  (via drill 0.35)
  Top 0.076: U1.G31 22.22,17.68 22.28,17.68 22.38,17.78 22.89,17.78
  Top 0.102: 23.54,17.78 C4.1 24,17.89 24.57,17.89 v24.59,17.87 | U1.A27 21.12,19.29 21.48,19.64 21.48,20.31 21.73,20.55 21.73,21.76 C3.1 | 21.86,21.9 v21.03,21.9
  Top 0.152: L2.1 21.98,23.23 21.98,22.01 21.86,21.9 C3.1 | 22.89,17.78 23.54,17.78
  Bottom 0.102: v24.59,17.87 24.64,17.82 24.64,17.64 21.94,17.64 21.47,18.12 21.47,20.41 21.61,20.55 21.61,21.2 21.03,21.78 v21.03,21.9
N$9
  Top 0.102: C7.1 17.35,20.53 18.07,19.81 18.12,19.81 18.32,19.6 U1.A13
N$10
  Top 0.102: SW1.2 26.65,24.15 26.19,23.69 24.92,23.69 24.42,23.18 U7.2
N$11
  Top 0.508: C19.1 L4.2
  Top 0.61: ANT1.2 28.18,12.55 U2.1
  Top 0.813: L4.2 28.18,14.58 ANT1.2
N$12
  Top 0.305: 13.96,28.34 14.11,28.49 14.25,28.49 14.64,28.89 IC7.5
  Top 0.61: 13.96,28.34 L5.2
N$13
  Top 0.152: U11.2 8.81,22.99 8.47,22.65 C28.1
N$14
  Top 0.152: U11.4 9.21,21.9 8.61,21.9 8.36,22.14 C28.2
N$15
  Top 0.152: C30.1 22.17,25.3 22,25.3 21.76,25.55 U13.2
N$16
  Top 0.305: U13.4 22,26.85 22.4,26.45 22.4,25.78 C30.2
N$17
  Top 0.152: IC6.13 9.64,25.78 R7.1
N$18
  Top 0.152: IC6.14 R8.1
N$19
  Top 0.152: IC6.15 10.75,26.62 R9.1
N$20
  Top 0.102: IC6.6 7.14,27.51 6.87,27.78 6.61,27.78 6.35,27.52 6.35,27.04 6.24,26.93 6.18,26.88 5.87,26.56 U12.3
N$21
  Top 0.102: U10.16 7.75,15.25 7.64,15.14 6.25,15.14 6.02,14.9 5.13,14.9 4.81,14.58 4.81,14.16 4.47,13.82 4.15,13.82 4.08,13.75 C32.1
N$22
  Top 0.102: C33.1 2.39,13.7 2.39,14.07 1.98,14.48 1.98,14.73 2.44,15.19 2.44,15.85 2.97,16.39 4.09,16.39 4.2,16.39 4.67,15.91 5.03,15.91 5.56,16.44 U10.13
N$23
  Top 0.102: C34.1 4.12,18.96 ELEC1.1
N$24
  Top 0.102: U10.5 8.24,19.83 8.24,20.79 8.12,20.91 6.51,20.91 6.18,20.58 6.18,19.42 U10.8
N$25
  Top 0.102: C35.1 2.67,16.8 ELEC2.1
N$26
  Top 0.102: R10.2 18.89,4.25 D1.C
NPNBASE1
  Top 0.102: U5.2 7.42,13.78 7.1,13.78 6.98,13.67 6.98,11.52 6.75,11.29 6.75,10.75 7.32,10.18 7.58,10.18 7.7,10.06 IC2.5 9.14,10.06 9.48,10.4 9.48,10.97 9.75,11.24 9.91,11.24 C22.2
  Top 0.152: R3.2 7.53,14.22 U5.2
NPNBASE2  (via drill 0.35)
  Top 0.102: U6.2 6.86,5.18 7.18,5.18 7.3,5.3 7.3,5.34 8.67,6.71 IC3.5 9.34,6.09 v9.4,6.09 | C23.2 1.6,11.18 v1.69,11.1 v1.69,11.09 | R4.2 4.67,5.96 v4.64,5.96
  Route2 0.102: 4.64,7.05 6.39,8.8 6.81,8.8 7.64,7.97 7.82,7.97 9.4,6.38 v9.4,6.09 | v1.69,11.09 1.69,11.04 2.34,10.39 3.87,10.39 4.72,9.55 4.72,9.07 4.64,8.99 4.64,7.05 | 4.64,7.05 4.64,6.05 v4.64,5.96
OSEL
  Top 0.102: IC7.1 14.78,30.79 12.36,30.79 11.88,30.31 11.37,30.31 11.29,30.23
  Top 0.152: IC6.3 8.53,28.58 8.44,28.67 8.44,28.86 8.96,29.38 9.63,29.38 10.09,29.84 10.91,29.84 11.29,30.23
P0.00
  Top 0.152: U1.N1 15.66,16.44 15.55,16.44 15.31,16.69 14.72,16.69 14.16,17.24 14.16,18.77 13.62,19.31 32KHZ.1
P0.01
  Top 0.152: U1.R1 15.35,15.98 14.96,16.38 14.59,16.38 14.16,16.81 32KHZ.2
P0.04  (via drill 0.35)
  Route2 0.102: v25.98,8.86 25.69,9.15 25.69,9.46 25.72,9.5 25.72,11.77 22.91,14.58 20.44,14.58 20.25,14.77 20.25,15.37 19.98,15.64 19.85,15.64 18.65,16.84 18.18,16.84 17.83,17.18 17.83,17.88 16.02,19.69 v16.02,19.96
  Route15 0.102: U1.V2 15.77,15.74 15.77,16.89 15.91,17.03 16.27,17.03 16.48,17.24 16.48,18.36 15.98,18.85 15.98,20 v16.02,19.96
  Bottom 0.102: J3.1 24.97,7.85 v25.98,8.86
P0.05  (via drill 0.35)
  Route2 0.102: U1.Y2 16.08,15.03 15.98,15.03 15.62,15.39 15.62,15.96 15.22,16.36 12.75,16.36 12.5,16.61 12.41,16.61 10.45,18.57 7.37,18.57 6.17,19.77 6.17,20.59 6.79,21.21 8.55,21.21 10.42,19.34 10.76,19.34 11.04,19.06 11.61,19.06 v12.82,17.84
  Bottom 0.076: 15.91,12.35 15.66,12.61 15.27,12.61
  Bottom 0.102: J3.5 20.84,10.17 20.84,10.47 20.69,10.61 20.69,11.67 20.61,11.76 20.61,12.2 20.43,12.38 20.4,12.35 15.91,12.35 | 15.27,12.61 15.23,12.65 14.84,12.65 14.68,12.81 14.36,12.81 13.98,13.19 13.98,14.55 13.38,15.15 13.31,15.15 12.82,15.64 v12.82,17.84
P0.06  (via drill 0.35)
  Route2 0.102: U1.P$10 13.93,14.58 13.43,15.08 13.43,15.15 13.38,15.21 13.26,15.21 13.25,15.21 12.77,15.21 12.76,15.2 11.91,15.2 11.79,15.32 8.35,15.32 7.36,16.31 5.43,16.31 4.94,15.82 4.7,15.82 4.39,16.13 3.63,16.13 3.57,16.08 3.57,15.26 3.85,14.98 4.47,14.98 4.93,14.52 6.91,14.52 7.06,14.36 11.19,14.36 11.77,13.79 13.01,13.79 13.02,13.8 13.69,13.8 14.84,12.65 14.99,12.65 15.92,11.72 15.92,8.01 16.53,7.4 17.39,7.4 19.11,9.12 v19.11,9.63
  Bottom 0.102: J3.7 24.14,6.29 23.91,6.52 23.74,6.52 23.7,6.49 21.66,6.49 21.02,5.85 21.02,4.47 20.32,3.77 20.32,3.29 20.65,2.96 20.65,2.48 20.31,2.14 19.83,2.14 17.61,4.36 17.61,6.75 19.19,8.33 19.19,9.55 v19.11,9.63
P0.11  (via drill 0.35)
  Route2 0.102: U1.P$15 16.52,18.27 16.09,18.71 13.73,18.71 10.62,21.82 7.4,21.82 7.37,21.79 v7.28,21.79
  Bottom 0.102: J2.9 6.43,22.8 7.28,21.94 v7.28,21.79
P0.25  (via drill 0.35)
  Route2 0.102: U1.P$27 21.37,13.03 21.37,13.13 22.03,13.79 23.24,13.79 24.27,12.75 24.27,6.14 24.31,6.1 24.31,5.38 22.46,3.53 v20.9,3.53
  Bottom 0.102: J3.9 23.74,6.04 21.22,3.53 v20.9,3.53
P0.30  (via drill 0.35)
  Route2 0.102: v6.89,25.05 10.8,25.05 11.79,24.06 17.37,24.06 17.71,23.72 19.77,23.72 20.31,23.18 20.31,20.55 20.52,20.34 U1.P$34
  Bottom 0.102: J2.8 6.02,24.04 6.02,24.38 6.14,24.49 6.33,24.49 v6.89,25.05
P0.31  (via drill 0.35)
  Route2 0.102: U1.P$33 20.08,18.63 20.08,18.73 19.87,18.94 19.12,18.94 16.54,21.52 13.97,21.52 11.54,23.95 11.06,23.95 10.9,23.8 v8.15,23.8
  Bottom 0.102: J2.10 6.42,23.98 6.56,24.12 7.83,24.12 v8.15,23.8
P1.08  (via drill 0.35)
  Top 0.102: U1.AL23 20.32,11.93 19.89,11.93 v19.74,11.77 | v20.07,2.72 19.65,2.3 D1.A
  Bottom 0.102: v19.74,11.77 19.74,6.5 20.77,5.47 20.77,4.58 20.07,3.87 20.07,3.18 v20.07,2.72
P1.09  (via drill 0.35)
  Route2 0.102: U1.P$26 20.88,12.94 20.88,12.84 20.67,12.63 20.67,11.65 v21.27,11.05
  Bottom 0.102: J3.3 21.27,10.23 v21.27,11.05
P1.12
  Bottom 0.102: U1.P$31 19.28,18.63 19.28,18.73 13.15,24.86 13.15,25.31 12.45,26 6.89,26 5.61,24.73 J2.6
P1.13  (via drill 0.35)
  Top 0.102: U1.A17 19.04,19.07 19.04,19.24 18.86,19.42 18.86,20.21 19.13,20.48 v19.13,20.56
  Bottom 0.102: J2.4 5.26,24.76 7.83,27.33 12.75,27.33 14.45,25.63 18.63,25.63 19.37,24.89 19.37,24.2 19.13,23.96 v19.13,20.56
P1.14
  Bottom 0.102: U1.P$30 18.88,18.63 18.88,18.73 18.67,18.94 18.27,18.94 17.92,18.58 11.73,18.58 10.56,17.42 10.08,17.42 9.39,16.72 9.39,15.99 8.99,15.59 8.35,15.59 6.91,17.03 5.76,17.03 5.25,17.54 5.25,18.4 3.8,19.84 3.8,20.32 4.5,21.02 4.5,21.31 3.74,22.07 3.74,23.88 3.98,24.12 4.78,24.12 J2.2
PNPBASE
  Top 0.102: U5.5 9.33,13.78 9,13.78 8.88,13.67 8.88,13.34 8.44,12.89 7.94,12.89 7.59,12.54 7.59,11.6 7.83,11.36 IC2.7 9.38,11.36 10.25,12.23 10.39,12.23 C22.1
  Top 0.152: R1.1 10.23,14.05 U5.5
PNPBASE2  (via drill 0.35)
  Top 0.102: U6.5 8.23,4.64 7.9,4.64 7.37,4.11 v7.37,3.61 | IC3.7 8.65,7.94 8.03,7.94 | C23.1 1.6,13.03 v1.3,13.33 | R2.1 10.1,7.54 v10.21,7.65 | 8.03,7.94 7.84,7.94 7.82,7.97 7.34,7.97 7.31,7.93 v6.85,7.93 | v6.54,10.07 6.76,9.85 6.76,9.21 8.03,7.94
  Route2 0.102: v1.3,13.33 2.48,13.33 5.07,10.74 6.18,10.74 6.92,10 | 6.92,10 6.62,10 v6.54,10.07 | 6.92,10 7.1,10.18 7.68,10.18 v10.21,7.65 | v6.85,7.93 6.83,7.91 6.12,7.91 5.1,6.89 5.1,6.31 5.22,6.2 5.22,5.77 v7.37,3.61
PSCNTL0  (via drill 0.35)
  Top 0.102: U1.W1 15.64,15.1 15.53,15.1 15.28,14.84 14.84,14.84 14.56,14.57 13.08,14.57 v13.01,14.63 | IC6.11 9.98,24.06 10.32,24.06 11,23.37 v11.3,23.37
  Route2 0.102: v11.3,23.37 12.25,22.42 12.45,22.42 13.94,20.93 v13.95,20.94
  Route15 0.102: v13.95,20.94 13.85,20.85 13.85,20.1 13.61,19.85 13.61,16.49 14.07,16.03 14.07,15.55 13.16,14.63 v13.01,14.63
PSCNTL1  (via drill 0.35)
  Top 0.102: IC6.10 8.8,24.55 v8.8,24.42
  Route2 0.102: U1.P$22 19.32,13.96 18.55,14.73 18.27,14.73 17.58,15.42 17.58,17.77 16.33,19.02 13.78,19.02 10.73,22.07 8.84,22.07 7.17,23.74 7.88,24.45 8.77,24.45 v8.8,24.42
PSEN  (via drill 0.35)
  Top 0.102: IC7.3 14.51,29.89 14.32,30.08 14.13,30.08 13.68,29.63 13.04,29.63 12.92,29.75 11.88,29.75 v11.53,29.41 | U12.1 5.26,25.7 5.26,25.58 v5,25.32 | 25.27,12.47 25.27,12.79 25.01,13.04 25.01,13.6 23.53,15.08 23.16,15.08 22.66,15.58 U1.U31 | 25.27,12.47 | 25.27,12.47 25.28,12.47 v25.56,12.75 | v12.11,26.58 12.88,26.58 IC4.C2
  Route2 0.102: v11.53,29.42 v11.53,29.41 9.56,29.41 5.46,25.32 v5,25.32 | 12.11,26.6 12.58,26.13 16.18,26.13 17.08,25.23 19.03,25.23 22.64,21.62 22.64,19.39 21.9,18.65 21.9,15.47 22.52,14.85 23,14.85 25.1,12.75 v25.56,12.75
  Route2 0.152: v11.53,29.42 12.11,28.85 12.11,26.6 v12.11,26.58
QSPI1  (via drill 0.35)
  Route2 0.102: U1.P$17 17.32,12.09 17.46,11.95 17.46,11.3 17.17,11.01 17.17,10.16 v17.19,10.14 | v6.38,21.96 6.38,21.21 5.92,20.75 5.92,17.98 4.73,16.78 4.88,16.63 4.88,16.4 4.91,16.43 | 4.91,16.43 | 4.91,16.43 4.86,16.49 v4.86,16.55
  Bottom 0.102: v17.19,10.14 15.87,10.14 15.09,9.37 14.09,9.37 12.96,10.49 11.55,10.49 11.33,10.27 7.16,10.27 6.69,10.74 5.14,10.74 4.59,11.29 4.59,12.98 3.47,14.1 3.47,15.63 3.57,15.73 3.57,15.8 4.24,16.46 4.79,16.46 4.86,16.53 v4.86,16.55
  Bottom 0.152: J2.7 5.96,22.42 6.38,22.01 v6.38,21.96
QSPI2  (via drill 0.35)
  Route2 0.102: U1.P$18 17.72,12.12 17.72,11.2 17.55,11.02 17.55,10.6 17.92,10.23 v17.92,9.6 v17.91,9.59
  Route15 0.102: v3.16,22.29 3.51,22.29 4.08,21.73 5.34,21.73 v5.71,21.36
  Bottom 0.102: v17.91,9.59 v17.92,9.59 17.92,7.92 17.49,7.5 15.69,7.5 14.47,8.71 13,8.71 12.82,8.54 7.42,8.54 7.19,8.77 5.85,8.77 4.65,9.98 4.65,10.46 4.09,11.02 4.09,12.13 2.96,13.26 2.96,15.79 2.96,15.84 3.02,15.9 3.02,21.9 3.16,22.04 v3.16,22.29
  Bottom 0.152: J2.5 5.61,22.35 5.44,22.17 5.44,21.49 5.54,21.38 5.69,21.38 v5.71,21.36
QSPI3  (via drill 0.35)
  Route2 0.102: v18.15,10.81 18.12,10.79 18.12,11.34 17.97,11.49 17.97,12.01 18.12,12.16 U1.P$19
  Route15 0.102: v2.89,23.25 2.89,22.88 2.47,22.46 2.47,21.7 3.5,20.67 4.68,20.67 4.81,20.54 v5.2,20.54
  Bottom 0.102: v18.15,10.81 18.15,10.76 18.53,10.38 18.53,9.16 18.34,8.98 18.34,7.86 17.72,7.25 15.51,7.25 14.44,8.31 14.44,8.38 13.03,8.38 12.93,8.28 7.32,8.28 7.09,8.51 5.75,8.51 4.39,9.87 4.39,10.36 3.83,10.92 3.83,12.03 2.47,13.39 2.47,15.71 2.74,15.97 2.74,21.9 2.58,22.05 2.58,22.85 2.89,23.16 v2.89,23.25 | 5.1,20.47 5.1,20.43 v5.2,20.54
  Bottom 0.152: J2.3 5.23,22.77 5.23,22.4 5.1,22.26 5.1,20.47
QSPI4  (via drill 0.35)
  Route2 0.102: U1.P$20 18.52,12.61 19.13,12.01 19.13,10.47 18.53,9.87 18.53,9.36 v17.25,8.08 | v4.32,22.31 3.81,21.8 3.81,21.61 v3.6,21.39
  Bottom 0.102: v4.32,22.31 4.42,22.31 J2.1 | v17.25,8.08 15.84,8.08 15.84,8.07 15.72,8.07 14.8,9 12.93,9 12.72,8.79 8.94,8.79 8.71,9.02 5.96,9.02 4.9,10.08 4.9,10.57 4.34,11.13 4.34,12.24 3.31,13.27 3.31,13.9 3.22,13.99 3.22,15.74 3.32,15.84 3.32,20.2 3.88,20.77 3.88,21.25 3.75,21.38 3.61,21.38 v3.6,21.39
REEDSWCH  (via drill 0.35)
  Top 0.102: U1.R31 22.21,16.07 23,16.07 v23.4,15.66 | U7.3 25.12,22.63 v24.68,22.63
  Route2 0.102: v23.4,15.66 23.42,15.68 23.58,15.68 24.18,16.28 24.18,17.45 23.98,17.65 23.98,21.93 v24.68,22.63
RESET
  Top 0.102: J1.10 23.53,10.94 24.2,11.61 24.2,12.97 22.78,14.38 U1.AC31
RF
  Top 0.305: 25.16,16.61 L1.1
  Top 0.406: L1.1 25.03,15.91 C17.1 | L4.1 C18.1
  Top 0.61: L4.1 25.83,15.93 25.16,16.61
S3
  Top 0.102: U10.9 4.39,18.64 3.99,18.24 3.99,17.29 4.14,17.14 5.49,17.14 | U10.12 5.49,17.14 | C35.2 4.29,16.8 4.62,17.13 5.48,17.13 5.49,17.14
S4
  Top 0.102: U10.4 8.49,18.64 | C34.2 5.3,19.3 5.93,19.93 5.93,20.75 6.34,21.16 8.22,21.16 8.49,20.89 8.49,18.64 | 8.49,18.64 9.74,18.64 9.99,18.89 10.47,18.89 10.81,18.56 10.81,17.66 10.56,17.42 9.98,17.42 9.68,17.12 9.07,17.12 9.04,17.14 U10.1
SCLK  (via drill 0.35)
  Top 0.102: U1.AE1 15.06,13.98 14.88,13.8 14.46,13.8 14.4,13.74 14.02,13.74 13.88,13.59 13.88,13.02 13.5,12.64 13.01,12.64 12.42,13.23 11.95,13.23 11.55,12.84 11.55,12.65 11.38,12.48 U3.8 12.28,12.27 v12.28,12.44 | U4.8 10.5,5.43 v10.44,5.37
  Route2 0.102: v10.44,5.37 10.44,5.46 10.98,6 10.98,9.89 11.56,10.47 12.2,10.47 12.91,11.18 12.91,11.29 12.91,11.89 12.35,12.44 v12.28,12.44
SDI
  Top 0.102: U1.AA1 15.64,14.7 15.49,14.7 15.38,14.59 14.95,14.59 14.67,14.31 13.63,14.31 13.26,13.94 12.2,13.94 10.97,12.71 10.97,11.57 10.39,10.99 9.86,10.99 9.74,10.87 9.74,10.3 9.89,10.14 U3.10 10.21,9.99 9.86,9.99 9.63,9.76 9.63,6.68 9.98,6.33 9.98,5.85 9.48,5.34 9.48,4.46 9.73,4.2 U4.10
STIM_CS1
  Top 0.102: U1.AL9 17.52,11.7 17.59,11.64 17.59,11.37 16.52,10.29 15.6,10.29 15.54,10.29 15.33,10.29 14.39,11.23 13.03,11.23 U3.7
STIM_CS2  (via drill 0.35)
  Top 0.102: U4.7 12.93,5.74 v13.49,5.74 | U1.AL29 22.26,11.85 v22.41,11.85
  Route2 0.102: v13.49,5.74 17.96,5.74 18.36,6.15 21.61,6.15 22.46,7 22.46,11.68 22.41,11.73 v22.41,11.85
SWDCLK
  Top 0.102: 18.67,8.83 18.07,8.41 18.04,8.24 19.73,5.81 19.9,5.78 20.05,5.89 20.58,5.89 20.92,6.24 21.89,6.24 23.84,8.19 24.05,8.19 24.13,8.27 24.27,8.27 25.14,9.14 25.14,10.04 24.71,10.48 24.71,13.55 24.36,13.89 23.43,14.83 23.06,14.83 22.7,15.18 U1.W31 | 18.67,8.83 | 18.67,8.83 | 18.67,8.83 18.77,8.93 19.55,8.93 J1.04
SWDIO
  Top 0.102: 22.48,7.58 22.73,7.75 22.86,7.75 23.15,8.04 23.33,8.04 23.74,8.45 23.94,8.45 24.02,8.53 24.14,8.53 24.84,9.23 24.84,9.87 24.45,10.26 24.45,13.24 23.12,14.58 22.95,14.58 22.74,14.78 U1.AA31 | J1.02 20.2,6.51 21.41,6.51 22.48,7.58 | 22.48,7.58
TOREG  (via drill 0.35)
  Top 0.152: 23.7,26.77 U9.4 23.7,26.77 24.04,26.77 24.07,26.75 24.2,26.77 C37.1
  Top 0.305: U9.6 24.67,27.77 v25.16,27.28 25.16,27.23 C37.1
  Bottom 0.305: v25.16,27.28 24.16,27.28 23.4,26.52 20.73,26.52 17.5,29.75 BATTERY+.1
V01  (via drill 0.35)
  Top 0.102: v13.54,7.14 13.73,7.33 IC1.1
  Top 0.152: U3.1 14.17,7.91 IC1.1 | v5.64,10.16 5.53,10.06 IC2.4
  Route2 0.102: v5.64,10.16 5.64,9.88 6.46,9.05 6.92,9.05 7.41,8.56 7.75,8.56 9.98,6.33 9.98,5.85 9.86,5.73 9.86,5.04 10.11,4.79 11.02,4.79 13.37,7.14 v13.54,7.14
V02  (via drill 0.35)
  Top 0.102: IC1.7 17.48,6.45 17.94,6.45 18.06,6.34 18.06,4.49 15.55,1.97 14.25,1.97 14.18,2.04 12.69,2.04 | U4.1 12.69,2.04 | IC3.4 4.98,6.71 5.42,7.15 6.17,7.15 v6.26,7.24 | v13.74,1.82 12.91,1.82 12.69,2.04
  Route2 0.102: v13.74,1.82 15.47,1.82 16.54,2.89 16.54,3.74 14.84,5.44 14.39,5.44 13.49,4.54 9.61,4.54 7.03,7.12 6.39,7.12 v6.26,7.24
V-  (via drill 0.35)
  Top 0.102: R4.1 5.41,5.43 5.51,5.53 5.51,6.43 5.64,6.55 v5.68,6.55 | U10.2 9.25,17.64 v9.31,17.69 | v6.99,6.34 7.29,6.04
  Top 0.152: 7.29,6.04 6.81,5.56 U6.1 | U5.1 7.67,14.73 R3.1 6.24,14.73 6.13,14.62 5.24,14.62 5.09,14.47 5.09,13.6 5.31,13.38 v5.31,13.04 | C29.1 13.8,21.74 U11.5 12.53,21.69 v12.45,21.61
  Route15 0.102: 7.24,6.09 7.04,6.3 5.93,6.3 v5.68,6.55 | v5.31,13.04 5.31,13.32 4.27,13.32 3.47,14.12 3.47,15.82 3.78,16.13 4.39,16.13 4.7,15.82 4.94,15.82 5.87,16.75 8.36,16.75 v9.31,17.69 | 7.3,6.04 7.24,6.09 | 7.24,6.09 v6.99,6.34
  Route15 0.152: 7.3,6.04 7.54,6.04 8.29,6.79 8.29,9.84 7.69,10.44 7.03,10.44 6,11.47 6,11.57 5.31,12.26 5.31,13.32 | v19.71,25.46 16.39,25.46 16.32,25.52 14.96,25.52 13.76,24.32 13.76,22.92 v12.45,21.61 11.31,20.47 v11.31,20.15
  Bottom 0.152: J3.4 25.6,5.94 25.86,5.68 26.24,5.68 26.74,6.18 27.01,6.18 27.46,6.63 27.46,7.58 26.58,8.45 26.58,18.16 25.78,18.96 25.78,22.62 26.21,23.05 26.21,25.03 25.89,25.34 19.83,25.34 v19.71,25.46 | v11.31,20.15 10.44,19.28 9.79,19.28 9.44,18.93 9.44,17.83 v9.31,17.69
VCC  (via drill 0.35)
  Top 0.102: U6.4 8.5,3.6 v8.29,3.39 | U5.4 9.84,13.64 v10.74,13.64 | IC9.6 3.36,15.2 3.63,15.2 4.05,14.78 4.05,14.58 v4.23,14.4 | R2.2 11.06,6.45 v11.56,6.45
  Top 0.152: v10.73,13.65 v10.74,13.64 10.74,13.89 11.05,14.19 11.05,14.36 R1.2 11.19,15.23 10.9,15.52 10.9,16.51 11.03,16.64 11.24,16.64 IC8.6 11.38,16.79 C36.1 | U10.11 4.65,17.64 v4.57,17.72 | C25.1 17.87,29.89 IC7.10 IC7.9 | 18.29,29.73 C25.1 | 18.16,29.86 18.8,29.86 C26.1 19.2,29.71 | 19.07,29.83 19.65,29.83 | v18.49,30.34 18.49,30.2 C25.1 | 19.91,29.85 19.89,29.87 C27.1 | v10.24,20.66 10.24,20.72 13.16,23.64 U11.8 12.85,24.55 12.79,24.61 12.37,25.03 v11.96,25.03 13.03,25.03 IC4.A2
  Top 0.254: IC7.10 18.14,29.89 18.16,29.86 18.29,29.73 | 19.04,29.86 19.07,29.83 19.2,29.71 | C27.1 20.48,29.65 v20.66,29.83
  Top 0.305: v20.66,29.83 20.52,29.98 19.91,29.98
  Top 0.406: C27.1 19.71,29.83 19.65,29.83 | 19.65,29.83 19.42,30.07 19.42,30.34 | 19.42,30.34 | 19.42,30.34 19.1,30.02 | 19.1,30.02 19.04,29.97 19.04,29.86 18.99,29.82 18.65,29.82 18.57,29.73 C25.1 18.31,30.02 | 18.31,30.02 18.17,30.02 v18.49,30.34 18.69,30.34 | 18.31,30.02 18.37,30.02 | 18.37,30.02 19.1,30.02 | 19.42,30.34 18.69,30.34 | 18.69,30.34 18.37,30.02 | 19.42,30.34 19.45,30.31 19.91,29.85 19.91,29.98 | C26.1 19.48,29.71 19.58,29.8 19.62,29.8 19.65,29.83
  Top 0.508: v20.66,29.83 19.92,29.83 19.45,30.31
  Route15 0.102: v10.73,13.65 10.63,13.54 8.29,13.54 7.19,14.64 4.47,14.64 v4.23,14.4 | v8.29,3.39 8.29,4.16 10.55,6.42 11.56,6.42
  Route15 0.152: v10.74,13.64 v10.73,13.65 | v10.74,13.64 11.39,14.29 11.39,18.01 10.46,18.94 5.89,18.94 4.67,17.72 v4.57,17.72 4.57,19.06 6.65,21.14 8.6,21.14 9.08,20.66 v10.24,20.66 | v11.56,6.45 11.56,6.42 10.82,7.17 10.82,11.35 10.53,11.64 10.53,12.39 10.74,12.61 v10.74,13.64 | v18.49,30.34 16.92,28.77 14.81,28.77 12.87,26.83 12.87,25.43 12.48,25.03 v11.96,25.03
  Bottom 0.152: J3.10 24.76,5.15 24.76,4.92 23.24,3.4 21.67,3.4 20.93,2.65 20.93,2.37 20.42,1.86 19.71,1.86 17.01,4.56 16.69,4.56 15.23,3.1 15.23,2.59 14.84,2.2 14.34,2.2 12.75,3.79 12.75,4.3 12.64,4.4 12.64,5.36 v11.56,6.45
VDD  (via drill 0.35)
  Top 0.102: U1.N31 22.21,16.47 23.03,16.47 23.13,16.56 v23.55,16.56 | U1.AJ31 22.73,13.18 22.95,12.96 v23.02,12.96 | U1.B28 21.41,18.67 21.41,18.71 21.47,18.77 21.47,19.27 21.74,19.54 21.74,19.67 22.05,19.99 v22.06,19.99 | 17.32,19.36 17.19,19.49 17.14,19.54 v17.02,19.66 | U1.AC1 15.64,14.3 15.59,14.3 15.53,14.24 14.95,14.24 14.77,14.06 13.84,14.06 13.26,13.47 v13.26,13.22 | U1.AL17 19.15,12.55 19.15,11.99 | 19.15,11.94 19.15,11.99 | 19.15,11.94 C11.1 19.17,11.17 C12.1 20.67,11.53 20.67,12.19 20.72,12.25 U1.AL25 | U1.AL3 16.29,12.58 15.89,12.18 15.56,12.18 15.32,12.42 15.32,12.99 v15.08,13.23 | U7.4 25.54,24.97 v25.54,24.26 | U4.5 13.64,4.29 U4.6 | 19.15,11.99 18.91,11.99 18.64,12.27 18.19,12.27 18.01,12.45 18.01,12.5 U1.AL11 | 19.15,11.94 19.11,11.94 18.94,11.77 v18.55,11.77 | v16.82,11.47 17.12,11.78 U1.AL7
  Top 0.15: 15.89,12.18 15.7,11.99 C13.1
  Top 0.152: J1.01 21.6,3.94 | U1.E31 22.18,18.04 22.26,18.04 22.57,18.34 23.01,18.34 v23.04,18.38 | SW1.1 30.06,20.43 v29.19,21.29 | C15.1 22.13,20.06 22.05,19.99 | U1.A19 19.52,19.47 19.74,19.69 19.74,19.99 | 19.74,19.99 19.44,19.69 v19.44,19.66 | 15.29,18.59 15.51,18.59 15.55,18.55 U1.C1 | C8.1 15.29,18.59 | C8.1 15.12,18.59 15.32,18.38 | 15.32,18.38 U1.E1 15.72,18.19 | 15.72,18.19 U1.C1 | U1.C1 15.53,18.38 | 15.5,18.38 15.32,18.38 | 15.29,18.59 15.5,18.38 | 15.72,18.19 15.53,18.38 | 15.53,18.38 15.5,18.38 | 15.29,18.59 15.29,19.46 v14.8,19.96 | C9.1 15.01,15.58 15.04,15.54 | U1.U1 15.68,15.54 15.04,15.54 | 15.09,13.54 15.09,13.42 15.08,13.41 v15.08,13.23 | 15.09,13.54 15.1,13.55 15.17,13.55 15.2,13.58 U1.AG1 | 15.09,13.54 15.01,13.54 14.93,13.46 14.46,13.46 C10.1 | 15.04,15.54 v15.04,15.42 | U1.L1 15.66,16.84 15.58,16.84 15.43,16.99 14.84,16.99 14.47,17.37 14.47,17.9 14.68,18.11 C8.1 | U3.14 11.97,7.91 12.1,7.79 v12.1,7.71 | 13.9,10.34 U3.6 14.08,10.47 14.33,10.47 v14.85,9.95 | 13.9,10.34 U3.5 | U4.14 11.81,1.97 v11.89,1.89 | 13.64,4.29 13.86,4.07 14.28,4.07 14.37,3.98 14.37,3.45 14.59,3.23 v14.59,2.8 | IC1.8 17.46,7.13 17.95,7.13 19.46,5.62 19.46,4.41 19.87,4 20.51,4 20.65,4.13 21.15,4.13 21.34,3.94 21.6,3.94 | C21.1 15.39,9.33 C20.1 15.17,9.26 14.42,10.01 14.23,10.01 13.9,10.34 | 17.14,19.54 17.32,19.36 U1.B8 | C24.1 14.59,27.29 v14.59,26.89 | v18.88,27.4 18.93,27.36 18.93,26.25 17.57,24.9 U13.8 15.63,23.92 15.63,21.55 15.91,21.27 C16.1 16.58,20.92 16.58,20.25 16.62,20.21 16.62,20.07 17.19,19.49 | L5.1 11.12,27.6 IC6.16 | C14.1 25.73,18.94 v26.43,19.64 | U12.4 4.87,25.95 4.78,25.95 4.31,25.48 4.31,24.79 v4.28,24.76
  Top 0.152: 21.6,3.94 21.51,3.85 21.51,2.5 v21.57,2.44 | C2.1 19.88,20.64 19.74,20.49 19.74,19.99
  Top 0.305: IC7.6 14.93,28.34 C24.1 | U9.1 22.52,28.92 22.47,28.97 22.24,28.97 22.19,28.93 C38.1 20.46,28.93 20.23,28.7 20.18,28.7 v18.88,27.4
  Top 0.406: IC7.4 14.87,29.37 14.41,29.37
  Top 0.508: 12.52,29 v12.67,29.15 14.19,29.15 14.41,29.37
  Top 0.813: L5.1 12.52,29 v12.66,29.14 | v12.66,29.14
  Route15 0.102: 22.92,18.22 22.92,18.49 22.06,19.35 v22.06,19.99 | 17.52,19.54 19.32,19.54 v19.44,19.66 | 23.02,12.84 22.81,12.64 22.48,12.64 22.44,12.59 19.73,12.59 19.16,12.03 19.16,11.99 19.11,11.94 | v23.02,12.96 23.02,12.89 23.04,12.92 23.04,14.19 24.14,15.29 24.14,16.14 23.55,16.73 v23.55,16.56 | v25.54,24.26 28.51,21.29 v29.19,21.29 | 16.95,11.74 17.38,11.74 17.9,12.27 18.41,12.27 18.73,11.94 19.11,11.94 | 19.11,11.94 18.94,11.77 v18.55,11.77 | v15.08,13.23 13.27,13.23 v13.26,13.22
  Route15 0.152: 23.02,12.89 23.02,12.84 23.02,12.1 23.02,11.6 22.93,11.51 22.93,3.99 | 23.55,16.73 23.13,16.73 22.74,16.34 22.14,16.34 21.94,16.54 21.94,17.24 22.92,18.22 23.04,18.34 v23.04,18.38 23.04,18.69 23.99,19.64 v26.43,19.64 27.54,19.64 v29.19,21.29 | v19.44,19.66 19.77,19.99 v22.06,19.99 | 15.04,15.55 15.04,15.54 15.08,15.5 v15.08,13.23 | 15.04,15.55 v15.04,15.42 | 12.1,7.79 12.1,7.8 14.5,10.2 | v11.89,1.89 13.22,3.22 | 13.22,3.22 13.22,5.16 12.89,5.49 12.89,7 12.1,7.79 | v12.66,29.14 | v12.66,29.14 7.97,24.45 5.02,24.45 4.71,24.76 v4.28,24.76 | 22.93,3.99 23.76,3.99 v26.86,7.09 | 22.93,3.99 22.93,3.93 21.57,2.57 v21.57,2.44 | 15.08,19.93 15.08,19.53 14.41,18.86 14.41,17.34 15.04,16.71 15.04,15.55 | 17.52,19.54 17.14,19.54 v17.02,19.66 17.02,20.17 16.37,20.82 15.57,20.82 15.08,20.33 15.08,19.93 | 15.08,19.93 15.05,19.96 v14.8,19.96 | v16.82,11.47 16.95,11.6 16.95,11.74 16.04,11.74 14.5,10.2 | 12.1,7.79 v12.1,7.71 | 14.5,10.2 14.6,10.2 v14.85,9.95 | 13.22,3.22 14.18,3.22 v14.59,2.8
  Bottom 0.152: J3.2 25.86,6.24 26.25,6.24 26.86,6.85 v26.86,7.09
  Bottom 0.305: v18.88,27.4 18.34,26.86 14.56,26.86 | 14.56,26.86 14.5,26.86 12.66,28.7 v12.66,29.14 | v14.59,26.89 14.56,26.86
VOUT1
  Top 0.152: U3.2 14.77,7.78 15.45,7.78 15.59,7.64 15.59,6.19 15.43,6.03 IC1.3
VOUT2
  Top 0.102: IC1.5 17.26,4.04 15.44,2.23 14.36,2.23 13.88,2.7 U4.2
VSS  (via drill 0.35)
  Top 0.102: IC1.4 14.76,4.76 14.74,4.74 v14.74,4.6
  Top 0.152: U13.5 16.55,26.79 15.34,26.79 14.59,26.03 14.59,25.84 14.88,25.55 15.05,25.55 C31.1 15.19,24.77 v15.28,24.68
  Route15 0.102: 13.4,1.22 13.38,1.24 | v18.63,1.42 17.41,1.42 16.19,2.64
  Route15 0.152: 13.38,1.24 13.26,1.36 11.53,1.36 10.13,2.75 10.13,4.13 12.24,6.24 12.24,6.84 12.04,7.04 11.82,7.04 11.36,7.5 11.36,8.98 11.12,9.23 11.12,11.48 10.83,11.77 10.83,12.27 12.53,13.97 13.54,13.97 14.35,14.78 14.35,16.67 13.93,17.09 13.93,19.78 14.13,19.99 14.13,20.15 16.48,22.5 16.48,23.54 15.34,24.68 v15.28,24.68 | 13.4,1.22 14.77,1.22 16.19,2.64 16.19,3.67 15.53,4.33 15.01,4.33 v14.74,4.6
  Bottom 0.102: J3.8 25.06,5.37 25.3,5.13 25.3,4.96 23.45,3.12 23.06,3.12 21.81,1.87 20.82,1.87 20.38,1.42 v18.63,1.42

## Text on the board
SilkscreenTop: C:/Users/bscov/OneDrive/Pictures/WITNe_LOGOv4.bmp